# EasyEDA Pro project 不晦启明_srm A.eprj, board PCB1
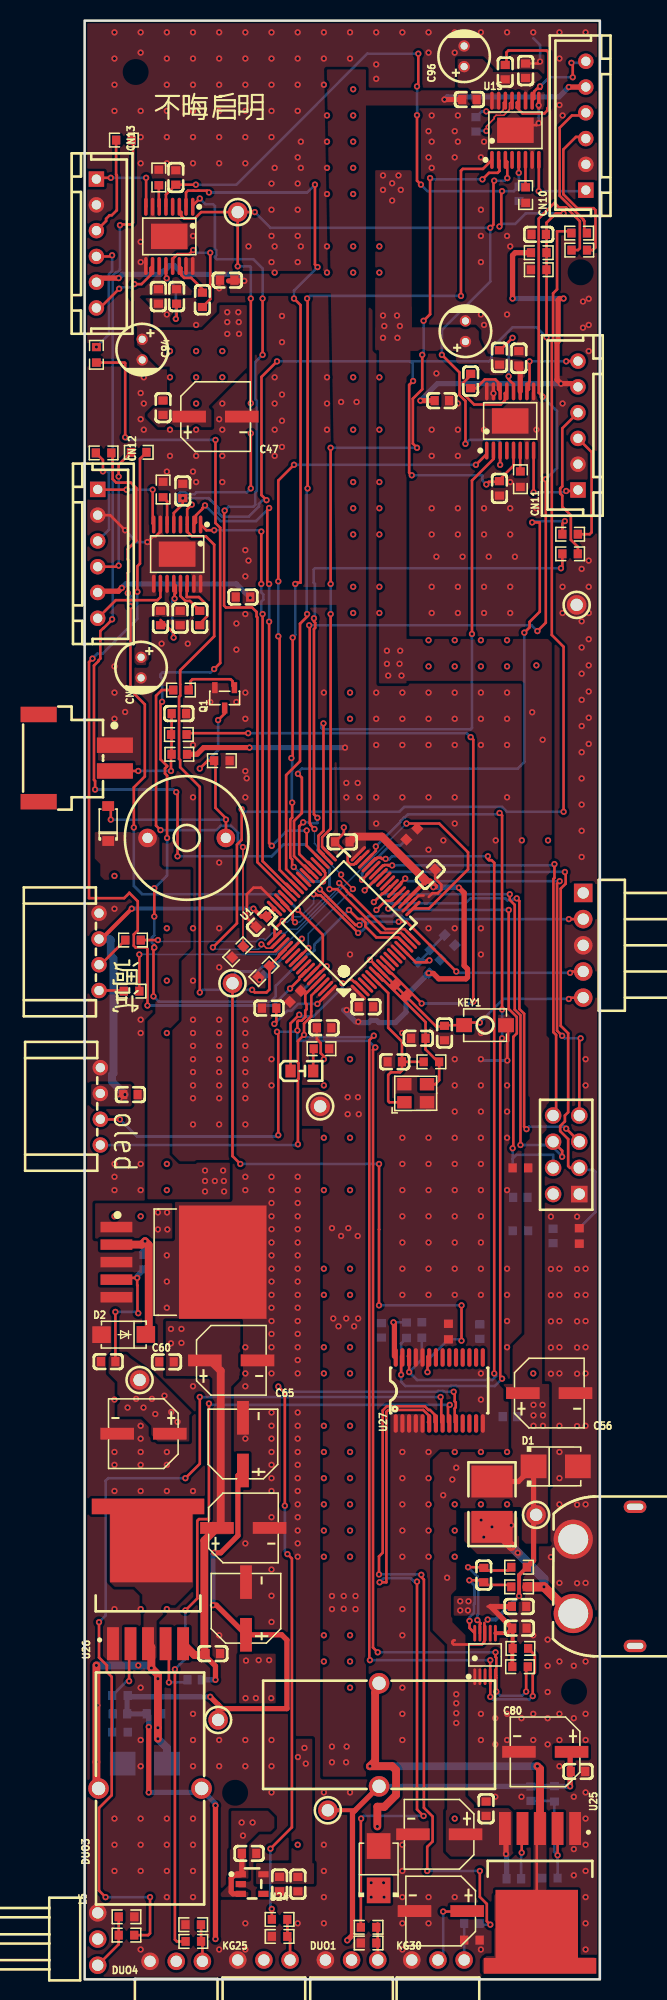
[diagram p13: board, top side]
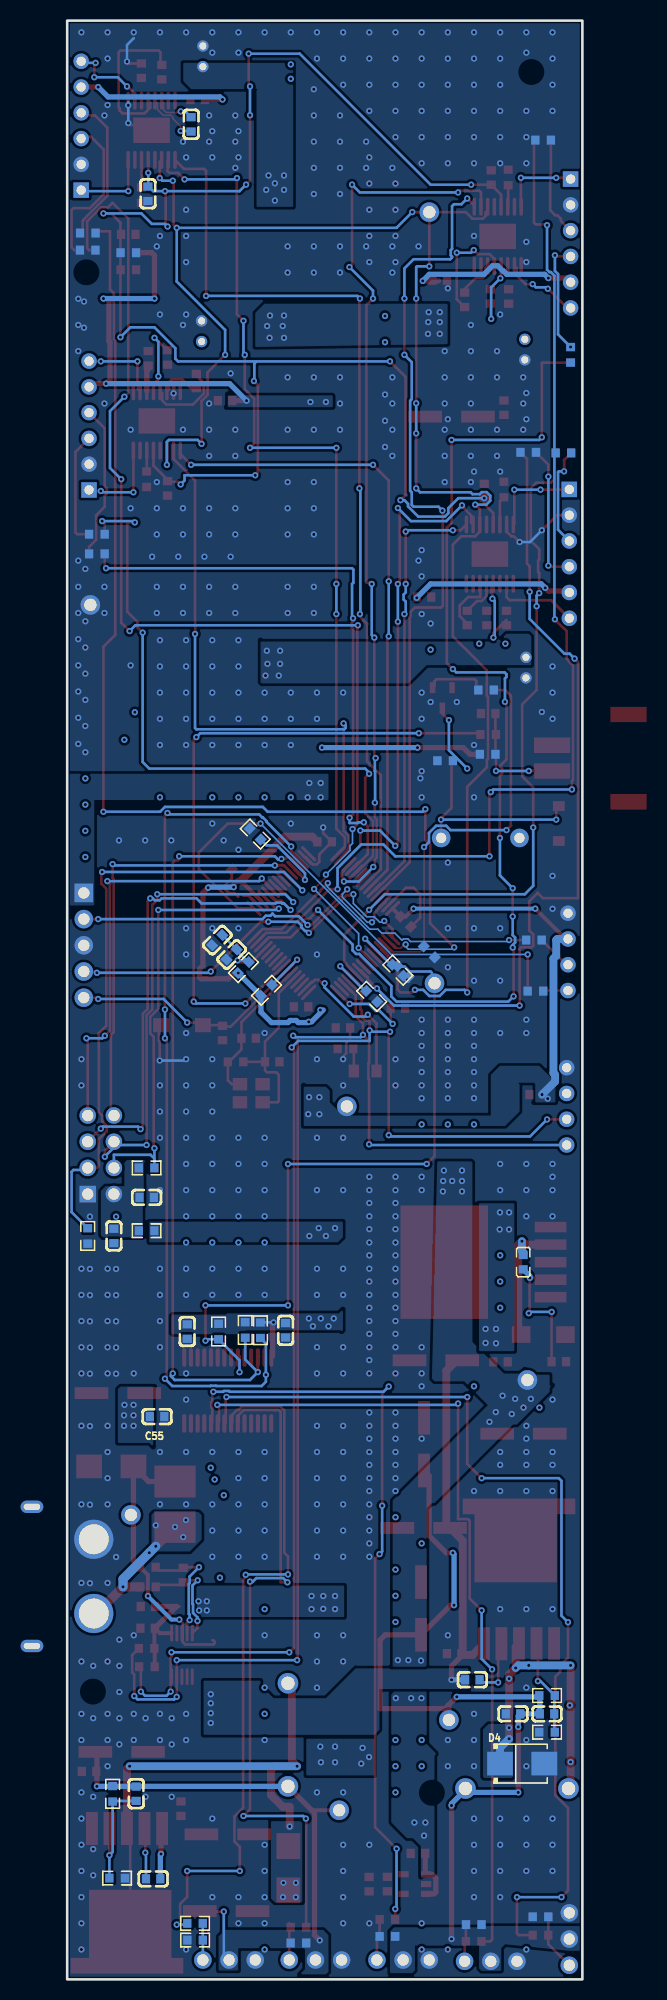
[diagram p14: board, bottom side, seen from below]

Outline 50 x 190 mm; copper layers: Top Layer, Bottom Layer. Coordinates in mm from the lower left corner of the outline.
Outline path: rectangle 50,0 0,190
Stack: Top Layer 0.035mm / Dielectric1 1.51mm FR4 er 4.5 / Bottom Layer 0.035mm

## Design rules (mm)
template: 自定义配置
spacing copperThickness1oz (default): track to track 0.102, other pairs 0.152 to 0.3
spacing copperThickness2oz: track to track 0.203, other pairs 0.152 to 0.3
track width copperThickness1oz (default): min 0.127, default 0.254, max 2.54
track width copperThickness2oz: min 0.203, default 0.254, max 2.54
differential pair differentialPair (default): width min 0.127, default 0.254, max 2.54; gap min 0.152, default 0.152
via viaSize (default): diameter min 0.5, default 0.61, max 10; hole min 0.3, default 0.305, max 6.3

## Placement (name value [footprint] x y rotation side)
BUZZER1  2.4kHz  [BUZ-TH_BD12.0-P7.60-D0.6-FD]  9.91 110.72 0 top
C10  15pF  [C0603]  32.39 91.29 0 top
C14  100nF  [C0603]  23.24 92.3 0 top
C15  100nF  [C0603]  33.53 107.16 225 top
C16  100nF  [C0603]  25.01 110.34 0 top
C17  100nF  [C0603]  17.14 102.59 45 top
C18  100nF  [C0603]  17.91 94.21 0 top
C24  15pF  [C0603]  30.1 89 0 top
C25  22nF  [C0603]  37.97 179.93 270 bottom
C26  100nF  [C0603]  40.82 185 270 top
C27  100nF  [C0603]  42.8 185.14 270 top
C28  100nF  [C0603]  42.16 173.2 90 bottom
C30  22nF  [C0603]  37.46 155.04 90 top
C31  100nF  [C0603]  40.26 157.33 270 top
C32  100nF  [C0603]  42.14 157.24 270 top
C33  100nF  [C0603]  40.26 144.63 90 top
C35  22nF  [C0603]  11.18 132.06 90 top
C36  100nF  [C0603]  7.37 132.06 90 top
C37  100nF  [C0603]  9.27 132.06 90 top
C38  100nF  [C0603]  9.52 144.37 270 top
C40  22nF  [C0603]  11.43 162.92 270 top
C41  100nF  [C0603]  8.93 163.24 90 top
C42  100nF  [C0603]  7.16 163.24 90 top
C43  100nF  [C0603]  8.85 174.78 270 top
C45  100nF  [C0603]  44.07 169.27 0 top
C46  1uF  [C0603]  7.61 152.46 270 top
C47  1000uF  [CAP-SMD_BD6.3-L6.6-W6.6-RD]  12.7 151.59 180 top
C48  100nF  [C0603]  37.34 182.35 0 top
C49  100nF  [C0603]  34.67 153.14 0 top
C50  100nF  [C0603]  15.37 134.09 180 top
C51  100nF  [C0603]  13.84 164.82 180 top
C52  100nF  [C0603]  38.73 39.22 270 top
C53  100nF  [C0603]  42.19 34.07 180 top
C54  1uF  [C0603]  42.16 36.17 180 top
C55  1uF  [C0603]  41.27 54.59 0 bottom
C56  1000uF  [CAP-SMD_BD6.3-L6.6-W6.6-RD]  45.08 56.87 180 top
C57  100nF  [C0603]  2.29 59.92 180 top
C60  100nF  [C0603]  7.95 59.9 0 top
C61  1uF  [C0603]  15.96 12.22 180 top
C62  1uF  [C0603]  20.7 9.24 90 top
C63  10uF  [C0603]  18.92 9.25 90 top
C64  330uF  [CAP-SMD_BD6.3-L6.6-W6.6-RD]  5.71 52.93 0 top
C65  220uF  [CAP-SMD_BD6.3-L6.6-W6.6-RD]  14.22 60.05 180 top
C66  1uF  [C0603]  38.96 16.55 90 top
C67  220uF  [CAP-SMD_BD6.3-L6.6-W6.6-RD]  34.42 14.07 0 top
C68  1uF  [C0603]  41.66 9.75 180 bottom
C69  1uF  [C0603]  47.88 20.17 0 top
C70  330uF  [CAP-SMD_BD6.3-L6.6-W6.6-RD]  34.57 6.63 0 top
C72  33nF  [C0603]  43.31 18.01 90 bottom
C73  1uF  [C0603]  12.45 31.6 0 top
C74  220uF  [CAP-SMD_BD6.3-L6.6-W6.6-RD]  15.4 43.79 180 top
C75  1uF  [C0603]  10.68 29.06 0 bottom
C76  1uF  [C0603]  6.73 25.76 0 bottom
C77  330uF  [CAP-SMD_BD6.3-L6.6-W6.6-RD]  15.66 35.98 270 top
C79  33nF  [C0603]  3.43 25.76 0 bottom
C80  2200uF  [CAP-SMD_BD6.3-L6.6-W6.6-RD]  44.7 22.07 0 top
C81  3300uF  [CAP-SMD_BD6.3-L6.6-W6.6-RD]  15.37 51.92 270 top
C82  1uF  [C0603]  38.35 62.84 270 bottom
C83  100nF  [C0603]  28.8 62.96 270 bottom
C84  100nF  [C0603]  35.43 100.81 315 bottom
C85  1uF  [C0603]  34.04 99.42 315 bottom
C86  4.7uF  [C0603]  27.3 94.34 180 top
C87  10uF  [C0603]  45.47 72.11 90 bottom
C88  100nF  [C0603]  42.28 75.85 0 bottom
C89  100nF  [C0603]  4.44 85.83 0 top
C90  100nF  [C0603]  9.14 122.78 0 top
C92  100uF  [CAP-TH_BD5.0-P2.00-D0.5-FD]  36.96 159.87 90 top
C94  100uF  [CAP-TH_BD5.0-P2.00-D0.5-FD]  5.59 158.09 270 top
C95  100uF  [CAP-TH_BD5.0-P2.00-D0.5-FD]  5.48 127.25 270 top
C96  100uF  [CAP-TH_BD5.0-P2.00-D0.5-FD]  36.83 186.54 90 top
C97  100nF  [C0603]  34.92 91.8 270 top
CN5  XT60PW-M  [CONN-TH_XT60PW-M]  50.42 39.09 180 top
CN6  HX-XH2.54-4PWZ-B  [CONN-TH_HX-XH2.54-4PWZ-B]  1.52 84.68 270 top
CN7  ZX-XH2.54-2PWT  [CONN-SMD_2P-P2.54_MEGASTAR_ZX-XH2.54-2PWT]  -0.76 118.47 270 top
CN9  HX-XH2.54-4PWZ-B  [CONN-TH_HX-XH2.54-4PWZ-B]  1.4 99.67 270 top
CN10  LAIL-PHC2.54-6P-01-XH-L  [CONN-TH_AXH-6A-11]  48.64 179.81 90 top
CN11  LAIL-PHC2.54-6P-01-XH-L  [CONN-TH_AXH-6A-11]  47.88 150.72 90 top
CN12  LAIL-PHC2.54-6P-01-XH-L  [CONN-TH_AXH-6A-11]  1.27 138.28 270 top
CN13  LAIL-PHC2.54-6P-01-XH-L  [CONN-TH_AXH-6A-11]  1.14 168.38 270 top
D1  SMBJ18A  [SMB_L4.3-W3.6-LS5.3-RD]  45.72 49.76 0 top
D2  SS54  [SMA_L4.3-W2.6-LS5.0-FD]  3.79 62.55 0 top
D3  SK1045B  [SMB_L4.3-W3.6-LS5.3-RD]  28.53 10.78 90 top
D4  SK1045B  [SMB_L4.3-W3.6-LS5.3-RD]  5.84 20.93 180 bottom
D10  1N4148W-E3-08  [SOD-123_L2.8-W1.8-LS3.7-RD]  2.29 112.12 90 top
DUO1  HX PZ2.54-1x3P WZ  [HDR-TH_3P-P2.54-H-M-W10.4-N]  25.91 1.88 0 top
DUO3  HX PZ2.54-1x3P WZ  [HDR-TH_3P-P2.54-H-M-W10.4-N]  1.27 3.91 270 top
DUO4  HX PZ2.54-1x3P WZ  [HDR-TH_3P-P2.54-H-M-W10.4-N]  8.89 1.75 0 top
H17  HX PZ2.54-1x5P WZ  [HDR-TH_5P-P2.54-H-M-W10.0-N]  48.39 100.31 270 top
H19  DS1023-2*4SF11  [HDR-TH_8P-P2.54-V-F-R2-C4-S2.54]  46.74 79.98 90 top
KEY1  轻触开关3x4x2  [SW-SMD_L4.0-W2.9-LS5.0]  38.86 92.56 0 top
KG25  HX PZ2.54-1x3P WZ  [HDR-TH_3P-P2.54-H-M-W10.4-N]  17.4 1.88 0 top
KG30  HX PZ2.54-1x3P WZ  [HDR-TH_3P-P2.54-H-M-W10.4-N]  34.29 1.88 0 top
L1  33uH  [L0603]  5.74 69.57 270 bottom
L4  47uH  [IND-TH_L22.5-W10.5-P10.00-D1.0]  28.58 23.72 0 top
L5  47uH  [IND-TH_L22.5-W10.5-P10.00-D1.0]  6.35 18.52 90 top
LED1  -  [LED0805-RD_RED]  21.08 88.11 0 top
Q1  S8050  [SOT-23-3_L2.9-W1.3-P1.90-LS2.3-BR]  13.59 124.31 90 top
R13  1M  [R0603#2]  33.65 89 180 top
R14  10kΩ  [R0603]  30.66 95.94 315 bottom
R18  2K  [R0603#2]  22.99 90.27 0 top
R27  10kΩ  [R0603]  44.07 167.49 180 top
R28  30K  [R0603#2]  44.07 165.84 180 top
R29  2.2K  [R0603#2]  42.8 173.08 90 top
R31  2.2K  [R0603#2]  42.29 145.52 90 top
R33  2.2K  [R0603#2]  7.62 144.52 270 top
R35  2.2K  [R0603#2]  7.2 174.78 270 top
R37  10kΩ  [R0603]  17.4 97.77 225 top
R39  1K  [R0603]  48.01 167.74 0 top
R40  1K  [R0603]  47.99 169.39 0 top
R41  1K  [R0603]  47.12 140.18 0 top
R42  1K  [R0603]  47.12 138.28 0 top
R43  1K  [R0603]  1.84 148.07 180 top
R44  1K  [R0603]  5.25 148.13 180 top
R45  1K  [R0603]  3.81 178.41 180 top
R46  1K  [R0603]  1.14 157.58 90 top
R47  10  [R0603#2]  42.16 38.08 0 top
R48  10  [R0603#2]  42.16 39.98 0 top
R49  4.7K  [R0603#2]  42.29 32.11 180 top
R50  4.7K  [R0603#2]  42.26 30.33 0 top
R52  12.4K  [R0603#2]  45.58 18 270 bottom
R53  3.3k  [R0603#2]  45.15 9.82 180 bottom
R54  12.4K  [R0603#2]  3.43 27.53 180 bottom
R55  3.3k  [R0603#2]  3.43 23.98 0 bottom
R56  330  [R0603#2]  27.56 5.06 0 top
R57  10kΩ  [R0603]  27.56 3.53 180 top
R58  330  [R0603#2]  37.59 5.44 180 bottom
R59  10kΩ  [R0603]  37.59 3.81 0 bottom
R60  330  [R0603#2]  4.06 4.29 180 top
R61  10kΩ  [R0603]  4.06 6.07 0 top
R64  330  [R0603#2]  10.55 3.68 0 top
R65  10kΩ  [R0603]  10.54 5.31 180 top
R66  330  [R0603#2]  18.92 5.82 0 top
R67  10kΩ  [R0603]  18.92 4.17 180 top
R68  4.7k  [R0603#2]  31.24 62.97 90 bottom
R69  4.7k  [R0603#2]  32.72 62.99 270 bottom
R70  10kΩ  [R0603]  35.31 62.84 90 bottom
R71  10kΩ  [R0603]  20.45 95.35 45 bottom
R72  10kΩ  [R0603]  31.75 111.1 45 bottom
R74  10  [R0603#2]  32.89 98.15 135 bottom
R75  0  [R0603#2]  42.29 72.62 0 bottom
R76  10kΩ  [R0603]  48.01 72.11 270 bottom
R77  10kΩ  [R0603]  42.29 78.72 0 bottom
R78  10kΩ  [R0603]  14.86 99.67 45 top
R79  10kΩ  [R0603]  9.19 118.83 180 top
R80  1k  [R0603#2]  9.14 120.75 180 top
R81  10kΩ  [R0603]  13.32 118.21 0 top
R83  1K  [R0603]  4.7 100.81 180 top
R84  1K  [R0603]  4.55 95.86 180 top
R85  1K  [R0603]  9.35 125.07 180 top
R86  10K  [R0603#2]  17.91 97.89 225 bottom
R87  2mΩ  [RES-SMD_L6.4-W3.2_SD2512]  39.53 46.09 270 top
U1  -  [LQFP-64_L10.0-W10.0-P0.50-LS12.0-BL]  25.15 102.46 45 top
U15  DRV8874PWPR  [HTSSOP-16_L5.0-W4.4-P0.65-LS6.4-BL-EP]  41.81 179.36 0 top
U19  DRV8874PWPR  [HTSSOP-16_L5.0-W4.4-P0.65-LS6.4-BL-EP]  41.3 151.17 0 top
U20  DRV8874PWPR  [HTSSOP-16_L5.0-W4.4-P0.65-LS6.4-BL-EP]  8.98 138.25 180 top
U21  DRV8874PWPR  [HTSSOP-16_L5.0-W4.4-P0.65-LS6.4-BL-EP]  8.22 169.07 180 top
U22  INA226AIDGSR  [MSOP-10_L3.0-W3.0-P0.50-LS5.0-BL]  38.86 31.47 0 top
U23  LM2596S-5.0(UMW)  [TO-263-5_L10.2-W8.9-P1.70-BR]  8.25 69.57 180 top
U24  AP2112K-3.3TRG1  [SOT-23-5_L2.9-W1.6-P0.95-LS2.8-BR]  16.26 9.25 180 top
U25  XL4015E1  [TO-263-5_L10.2-W8.9-P1.70-TL]  44.2 9.63 270 top
U26  XL4015E1  [TO-263-5_L10.2-W8.9-P1.70-TL]  6.15 37.57 90 top
U27  PCA9685PW,118  [TSSOP-28_L9.7-W4.4-P0.65-LS6.4-TL]  34.42 57.12 90 top
U28  RH-5000  [TEST-TH_BD2.54-P1.4_RED]  14.86 171.43 0 top
U29  RH-5000  [TEST-TH_BD2.54-P1.4_RED]  12.95 25.17 0 top
U30  RH-5000  [TEST-TH_BD2.54-P1.4_RED]  47.75 133.32 0 top
U31  RH-5000  [TEST-TH_BD2.54-P1.4_RED]  23.61 16.41 0 top
U32  RH-5000  [TEST-TH_BD2.54-P1.4_RED]  14.35 96.62 0 top
U33  RH-5000  [TEST-TH_BD2.54-P1.4_RED]  22.86 84.68 0 top
U34  RH-5000  [TEST-TH_BD2.54-P1.4_RED]  43.81 45.06 0 top
U35  RH-5000  [TEST-TH_BD2.54-P1.4_RED]  5.33 58.14 0 top
X5  8MHz  [OSC-SMD_4P-L3.2-W2.5-BL]  32.13 85.95 0 top

## Footprints (pads in the part's own frame, mm; a bottom-side part is the same pattern mirrored in y, then rotated)
BUZ-TH_BD12.0-P7.60-D0.6-FD
  round 1.8 hole 1: 1(-3.8,0) 2(3.8,0)
C0603
  rect 0.8x0.9 smd: 1(-0.7,0) 2(0.7,0)
CAP-SMD_BD6.3-L6.6-W6.6-RD
  rect 3.26x1.15 smd: 1(2.555,0) 2(-2.555,0)
CAP-TH_BD5.0-P2.00-D0.5-FD
  round 1.1 hole 0.7: 1(-1,0) 2(1,0)
CONN-SMD_2P-P2.54_MEGASTAR_ZX-XH2.54-2PWT
  rect 1.5x3.5 smd: 1(-1.25,3.7) 2(1.25,3.7) 3(-4.23,-3.7) 4(4.23,-3.7)
CONN-TH_AXH-6A-11
  rect 1.5x1.5 hole 0.9: 1(-6.25,0)
  round 1.5 hole 0.9: 2(-3.75,0) 3(-1.25,0) 4(1.25,0) 5(3.75,0) 6(6.25,0)
CONN-TH_HX-XH2.54-4PWZ-B
  round 1.5 hole 0.9: 1(-3.75,0) 2(-1.25,0) 3(1.25,0) 4(3.75,0)
CONN-TH_XT60PW-M
  round 3.8 hole 2.9: 1(3,-3.6) 2(3,3.6)
  oval 2.2x1.2 hole 1.6x0.6: 3(-3,6.75) 4(-3,-6.75)
HDR-TH_3P-P2.54-H-M-W10.4-N
  round 1.7 hole 1.1: 1(-2.54,0) 2(0,0) 3(2.54,0)
HDR-TH_5P-P2.54-H-M-W10.0-N
  rect 1.8x1.8 hole 1.1: 1(-5.08,0)
  round 1.8 hole 1.1: 2(-2.54,0) 3(0,0) 4(2.54,0) 5(5.08,0)
HDR-TH_8P-P2.54-V-F-R2-C4-S2.54
  rect 1.6x1.6 hole 1.1: 1(-3.81,-1.27)
  round 1.6 hole 1.1: 2(-3.81,1.27) 3(-1.27,-1.27) 4(-1.27,1.27) 5(1.27,-1.27) 6(1.27,1.27) 7(3.81,-1.27) 8(3.81,1.27)
HTSSOP-16_L5.0-W4.4-P0.65-LS6.4-BL-EP
  oval 0.343x1.746 smd: 1(-2.275,-2.873) 2(-1.625,-2.873) 3(-0.975,-2.873) 4(-0.325,-2.873) 5(0.325,-2.873) 6(0.975,-2.873) 7(1.625,-2.873) 8(2.275,-2.873) 9(2.275,2.873) 10(1.625,2.873) 11(0.975,2.873) 12(0.325,2.873) 13(-0.325,2.873) 14(-0.975,2.873) 15(-1.625,2.873) 16(-2.275,2.873)
  rect 3.55x2.46 smd: 17(0,0)
IND-TH_L22.5-W10.5-P10.00-D1.0
  round 2 hole 1.3: 1(0,-5) 2(0,5)
L0603
  rect 0.8x0.864 smd: 1(-0.7,0) 2(0.7,0)
LED0805-RD_RED
  rect 1x1.25 smd: 1(-1.1,0) 2(1.1,0)
LQFP-64_L10.0-W10.0-P0.50-LS12.0-BL
  oval 0.3x2 smd: 1(-3.75,-5.75) 2(-3.25,-5.75) 3(-2.75,-5.75) 4(-2.25,-5.75) 5(-1.75,-5.75) 6(-1.25,-5.75) 7(-0.75,-5.75) 8(-0.25,-5.75) 9(0.25,-5.75) 10(0.75,-5.75) 11(1.25,-5.75) 12(1.75,-5.75) 13(2.25,-5.75) 14(2.75,-5.75) 15(3.25,-5.75) 16(3.75,-5.75) 33(3.75,5.75) 34(3.25,5.75) 35(2.75,5.75) 36(2.25,5.75) 37(1.75,5.75) 38(1.25,5.75) 39(0.75,5.75) 40(0.25,5.75) 41(-0.25,5.75) 42(-0.75,5.75) 43(-1.25,5.75) 44(-1.75,5.75) 45(-2.25,5.75) 46(-2.75,5.75) 47(-3.25,5.75) 48(-3.75,5.75)
  oval 2x0.3 smd: 17(5.75,-3.75) 18(5.75,-3.25) 19(5.75,-2.75) 20(5.75,-2.25) 21(5.75,-1.75) 22(5.75,-1.25) 23(5.75,-0.75) 24(5.75,-0.25) 25(5.75,0.25) 26(5.75,0.75) 27(5.75,1.25) 28(5.75,1.75) 29(5.75,2.25) 30(5.75,2.75) 31(5.75,3.25) 32(5.75,3.75) 49(-5.75,3.75) 50(-5.75,3.25) 51(-5.75,2.75) 52(-5.75,2.25) 53(-5.75,1.75) 54(-5.75,1.25) 55(-5.75,0.75) 56(-5.75,0.25) 57(-5.75,-0.25) 58(-5.75,-0.75) 59(-5.75,-1.25) 60(-5.75,-1.75) 61(-5.75,-2.25) 62(-5.75,-2.75) 63(-5.75,-3.25) 64(-5.75,-3.75)
MSOP-10_L3.0-W3.0-P0.50-LS5.0-BL
  oval 0.28x1.62 smd: 1(-1,-2.11) 2(-0.5,-2.11) 3(0,-2.11) 4(0.5,-2.11) 5(1,-2.11) 6(1,2.11) 7(0.5,2.11) 8(0,2.11) 9(-0.5,2.11) 10(-1,2.11)
OSC-SMD_4P-L3.2-W2.5-BL
  rect 1.4x1.2 smd: 1(-1.1,-0.875) 2(1.1,-0.875) 3(1.1,0.875) 4(-1.1,0.875)
R0603
  rect 0.806x0.864 hole 0.001: 1(-0.753,0) 2(0.753,0)
R0603#2
  rect 0.806x0.864 smd: 1(-0.753,0) 2(0.753,0)
RES-SMD_L6.4-W3.2_SD2512
  rect 3.1x4 smd: 1(-2.2,0) 2(2.2,0)
SMA_L4.3-W2.6-LS5.0-FD
  rect 1.8x1.62 smd: 1(-2.15,-0.009) 2(2.15,0.009)
SMB_L4.3-W3.6-LS5.3-RD
  rect 2.5x2.3 smd: 1(-2.15,0) 2(2.15,0)
SOD-123_L2.8-W1.8-LS3.7-RD
  rect 0.95x1.15 smd: 1(-1.692,0) 2(1.692,0)
SOT-23-3_L2.9-W1.3-P1.90-LS2.3-BR
  rect 1.07x0.532 smd: 1(0.99,-0.95) 2(0.99,0.95) 3(-0.99,0)
SOT-23-5_L2.9-W1.6-P0.95-LS2.8-BR
  rect 1x0.6 smd: 1(1.1,-0.95) 2(1.1,0) 3(1.1,0.95) 4(-1.1,0.95) 5(-1.1,-0.95)
SW-SMD_L4.0-W2.9-LS5.0
  rect 1.53x1.36 smd: 1(-2.035,0) 2(2.035,0)
TEST-TH_BD2.54-P1.4_RED
  round 1.9 hole 1.2: 1(0,0)
TO-263-5_L10.2-W8.9-P1.70-BR
  rect 3.083x1.02 smd: 1(5.16,-3.4) 2(5.16,-1.7) 3(5.16,0) 4(5.16,1.7) 5(5.16,3.4)
  rect 8.5x11 smd: 6(-5.16,0)
TO-263-5_L10.2-W8.9-P1.70-TL
  rect 3.2x1.15 smd: 1(-5.008,3.404) 2(-5.008,1.702) 3(-5.008,0) 4(-5.008,-1.702) 5(-5.008,-3.404)
  custom 8.128x10.922 smd: 6(5.008,-0.318)
TSSOP-28_L9.7-W4.4-P0.65-LS6.4-TL
  oval 1.804x0.406 smd: 1(-3.2,4.225) 2(-3.2,3.575) 3(-3.2,2.925) 4(-3.2,2.275) 5(-3.2,1.625) 6(-3.2,0.975) 7(-3.2,0.325) 8(-3.2,-0.325) 9(-3.2,-0.975) 10(-3.2,-1.625) 11(-3.2,-2.275) 12(-3.2,-2.925) 13(-3.2,-3.575) 14(-3.2,-4.225) 15(3.2,-4.225) 16(3.2,-3.575) 17(3.2,-2.925) 18(3.2,-2.275) 19(3.2,-1.625) 20(3.2,-0.975) 21(3.2,-0.325) 22(3.2,0.325) 23(3.2,0.975) 24(3.2,1.625) 25(3.2,2.275) 26(3.2,2.925) 27(3.2,3.575) 28(3.2,4.225)

## Nets
As in the schematic.

Pads without a net: CN5 3 4; CN7 3 4; U1 3 4 9 10 11 24 25 39 40 45 54 56 57; U15 4; U19 4; U20 4; U21 4; U22 3; U24 4; U27 11 12 13 15 16 17 18 19 20 21 22

## Via types
v1: diameter 0.61, hole 0.305, Top Layer to Bottom Layer, 1092 vias

## Routing (per net, layer and track width the routed paths; a pad name or vN(x,y) marks a point on that pad's centre or on a via; arc(x,y) is an arc through that point)
3V3: length 202.3
  Top Layer w0.254: C18.2 18.61,92.88 v1(18.42,92.69) ; v1(22.59,94.62) 23.72,95.75 U1.64 ; 39.39,36.17 39.12,36.17
  Top Layer w0.381: U1.48 17.64,103.09 17.64,103.09 17.16,103.09 v1(16.38,103.86) ; 41.54,34.02 R49.2 41.5,32.07 R50.1 ; CN9.2 1.63,100.92 v1(4.57,103.86) ; U1.19 33.02,106.45 33.02,106.66 33.03,106.67 ; C53.2 41.01,33.58 U22.6
  Top Layer w0.508: v1(33.85,105.94) 33.92,106.02 34.04,106.02 33.53,106.53 33.17,106.53 33.03,106.67 ; v1(32.59,153.14) 33.84,153.14 33.97,153.26 ; v1(34.92,182.35) C48.1 ; 33.34,97.57 33.85,97.57 34.37,97.05 37.01,97.05 37.16,97.21 37.16,98.01 36.83,98.34 36.83,105.39 v1(36.32,105.89) ; v1(16,119.48) 11.56,119.48 10.91,118.83 R79.1 ; v1(3.61,134.98) 3.29,134.66 1.4,134.66 ; 30.06,60.45 30.06,63.64 v1(29.97,63.73) ; C53.2 39.39,36.17 41.46,36.17 ; CN10.5 v1(46.99,183.56) ; v1(41.53,163.04) 41.53,167.23 41.78,167.49 R27.2 ; v1(15.49,164.75) 13.97,164.75 ; CN11.5 47.56,154.79 v1(46.23,154.79) 45.85,155.17 45.85,158.79 45.95,158.89 45.95,162.89 46.1,163.04 v1(46.48,163.04) ; 1.27,164.75 1.54,165.02 v1(3.3,165.02)
  Top Layer w0.762: C16.2 26.22,110.85 28.85,110.85 33.03,106.67
  Bottom Layer w0.254: v1(18.42,92.69) 19.68,93.95 20.05,93.95 20.72,94.62 v1(22.59,94.62) ; v1(29.97,63.73) 31.43,63.73 31.5,63.79
  Bottom Layer w0.381: v1(4.57,103.86) v1(16.38,103.86)
  Bottom Layer w0.508: v1(46.23,154.79) 34.24,154.79 v1(32.59,153.14) ; v1(34.92,182.35) 35.18,182.6 46.03,182.6 v1(46.99,183.56) ; R74.1 v1(33.4,97.61) R14.2 31.19,93.83 30.17,92.81 28.56,92.81 28.36,93.02 27.77,93.02 27.57,92.81 26.63,92.81 v1(26.55,92.89) 26.29,92.89 25.15,94.03 ; v1(16,119.48) v1(25.27,119.48) ; v1(46.48,163.04) v1(41.53,163.04) ; v1(16.08,134.01) 14.73,135.36 3.99,135.36 v1(3.61,134.98) ; v1(36.32,105.89) 36.27,105.94 v1(33.85,105.94) ; v1(15.49,164.75) 14.86,165.39 9.55,165.39 8.71,166.22 8.23,166.22 7.72,165.72 7.67,165.72 7.34,165.39 3.67,165.39 v1(3.3,165.02)
  Bottom Layer w0.762: CN9.2 2.43,100.92 2.54,100.81 2.54,99.29 2.81,99.02 2.81,87.9 2.68,87.78 2.68,87.75 2.64,87.71 2.64,87.1 v1(3.91,85.83)
  vias: v1(3.36,85.43) v1(20.7,21.56) v1(21.34,22.45) v1(21.46,20.93) v1(24,72.87) v1(24,37.19) v1(24,35.92) v1(24,22.58) v1(24,21.06) v1(24.13,64.11) v1(24.64,63.35) v1(24.89,153.01) v1(24.89,72.11) v1(25.15,37.19) v1(25.15,35.95) v1(25.37,21.06) v1(25.4,116.05) v1(25.4,114.66) v1(25.43,94.03) v1(25.39,64.11) v1(25.43,22.58) v1(25.53,85.57) v1(25.53,83.92) v1(25.59,72.87) v1(26.15,63.35) v1(26.29,37.19) v1(26.29,35.92) v1(26.39,153.01) v1(26.5,116.05) v1(26.52,85.57) v1(26.5,72.11) v1(26.55,64.11) v1(26.66,114.66) v1(26.61,83.92) v1(36.45,36.68) v1(36.45,35.79) v1(37.26,36.68) v1(37.2,35.79)
5V_LOGIC: length 19.2
  Top Layer w0.254: U23.4 3.26,68.05 v1(5.1,68.05) 5.1,67.33 5.13,67.31 5.13,64.7 v1(5.21,64.62) ; v1(2.99,64.75) C57.1
  Top Layer w0.508: 15.09,10.13 14.53,10.13 14.22,9.83 14.22,8.48 14.4,8.3 15.16,8.3 ; U24.1 15.26,10.3 C61.2
  Bottom Layer w0.254: v1(5.21,64.62) 5.08,64.75 v1(2.99,64.75)
  Bottom Layer w0.508: L1.2 5.1,68.24 v1(5.1,68.05)
  vias: v1(4.17,55.46) v1(5,56.31) v1(5.71,55.46) v1(6.52,56.31) v1(6.86,54.84) v1(7.75,56.62) v1(8.41,55.03) v1(9.02,54.08) v1(11.68,78.46) v1(11.68,77.45) v1(11.68,76.43) v1(12.64,77.45) v1(13.44,78.46) v1(13.51,77.45) v1(13.54,76.43) v1(15.24,15.22) v1(15.37,13.94) v1(15.66,30.92) v1(15.62,27.28) v1(16.31,15.22) v1(16.62,27.28) v1(16.89,30.96) v1(17.91,30.96) v1(18.11,27.28)
GND: length 44.8
  Top Layer w0.254: 32.89,105.13 32.41,105.13 31.51,104.23 ; 42.31,179.86 43.87,179.86 v1(44.07,180.06) ; U1.47 17.12,105.89 16.38,105.89 15.75,105.26 15.75,102.97 16.62,102.1 16.65,102.1 ; CN12.2 2.47,142.03 v1(3.94,140.56) ; U1.31 26.81,108.83 26.14,108.15 25.78,108.15 25.53,108.4 25.53,109.13 C16.1 25.16,111.19 v1(25.16,111.73) ; 34.02,107.66 34.02,106.78 34.62,106.19 34.62,105.7 34.28,105.36 33.76,105.36 33.4,105 ; v1(6.1,139.42) 6.65,139.97 6.89,139.97 7.35,140.44 U20.7 ; v1(23.22,89.26) 23.22,89.53 22.92,89.84 22.92,90.82 22.54,91.19 C14.1 ; v1(44.2,186.03) 44.01,185.84 C27.1 ; v1(41.02,89.13) 41.02,90.97 41.1,91.05 41.1,92.36 KEY1.2
  Bottom Layer w0.254: v1(6.1,139.42) 5.08,139.42 v1(3.94,140.56) ; v1(41.02,89.13) 38.35,89.13 38.35,89.15 v1(38.46,89.26) ; 44.07,182.09 v1(44.07,181.78) v1(44.07,180.06) ; 43.54,188.29 44.2,187.64 v1(44.2,186.03)
  vias: v1(2.9,188.86) v1(2.9,186.32) v1(2.9,183.78) v1(2.9,181.24) v1(2.9,127.36) v1(2.9,124.82) v1(2.9,122.28) v1(2.9,107.04) v1(2.9,103.85) v1(2.9,79.1) v1(2.9,77.85) v1(2.9,76.56) v1(2.9,74.02) v1(2.9,56.24) v1(2.9,51.16) v1(2.9,49.91) v1(2.9,47.37) v1(2.9,35.92) v1(2.9,15.6) v1(2.9,13.06) v1(2.9,10.52) v1(3.93,122.94) v1(5.44,188.86) v1(5.44,186.9) v1(5.44,181.24) v1(5.44,178.7) v1(5.44,176.16) v1(5.44,168.54) v1(5.44,166.58) v1(5.44,153.88) v1(5.44,151.34) v1(5.44,93.09) v1(5.44,91.8) v1(5.44,79.1) v1(5.44,76.56) v1(5.44,74.02) v1(5.44,53.7) v1(5.44,52.45) v1(5.44,51.16) v1(5.44,49.91) v1(5.44,47.37) v1(5.44,35.92) v1(5.44,28.3) v1(5.44,23.22) v1(5.44,20.68) v1(5.44,15.6) v1(5.44,13.06) v1(5.44,10.52) v1(5.44,2.9) v1(5.74,155.4) v1(5.74,152.86) v1(5.74,150.32) v1(7.47,129.56) v1(7.98,188.86) v1(7.98,186.32) v1(7.98,183.78) v1(7.98,181.24) v1(7.98,178.7) v1(7.98,176.16) v1(7.98,161.5) v1(7.98,146.26) v1(7.98,101.96) v1(7.98,96.88) v1(7.98,91.8) v1(7.98,79.1) v1(7.98,76.56) v1(7.98,70.23) v1(7.98,67.69) v1(7.98,65.15) v1(7.98,51.16) v1(7.98,49.91) v1(7.98,47.37) v1(7.98,35.92) v1(7.98,15.6) v1(7.98,13.06) v1(7.98,10.52) v1(7.98,7.98) v1(8.28,157.94) v1(8.28,155.4) v1(8.28,150.32) v1(8.28,147.78) v1(10.01,129.56) v1(10.52,188.86) v1(10.52,186.32) v1(10.52,183.78) v1(10.52,181.24) v1(10.52,178.7) v1(10.52,176.16) v1(10.52,169.12) v1(10.52,146.26) v1(10.52,119.74) v1(10.52,114.66) v1(10.52,101.96) v1(10.52,96.88) v1(10.52,93.09) v1(10.52,91.8) v1(10.52,90.55) v1(10.52,89.26) v1(10.52,88.01) v1(10.52,86.72) v1(10.52,85.47) v1(10.52,82.93) v1(10.52,57.53) v1(10.52,47.37) v1(10.52,25.76) v1(10.52,23.22) v1(10.52,20.68) v1(10.52,15.6) v1(10.52,13.06) v1(10.52,10.52) v1(10.52,7.98) v1(10.82,160.48) v1(10.82,157.94) v1(10.82,155.4) v1(10.82,152.86) v1(10.82,150.32) v1(10.82,147.78) v1(10.82,145.24) v1(12.19,123.9) v1(13.06,188.86) v1(13.06,186.32) v1(13.06,183.78) v1(13.06,181.24) v1(13.06,178.7) v1(13.06,176.16) v1(13.06,164.04) v1(13.06,151.34) v1(13.06,108.33) v1(13.06,101.96) v1(13.06,98.17) v1(13.06,93.09) v1(13.06,91.8) v1(13.06,90.55) v1(13.06,89.26) v1(13.06,88.01) v1(13.06,86.72) v1(13.06,85.47) v1(13.06,82.93) v1(13.06,33.38) v1(13.06,23.22) v1(13.06,20.68) v1(13.06,2.9) v1(13.36,157.94) v1(13.36,155.4) v1(13.36,152.86) v1(13.36,150.32) v1(13.36,147.78) v1(13.36,145.24) v1(14.73,131.52) v1(14.73,128.98) v1(14.73,123.9) v1(15.6,188.86) v1(15.6,186.32) v1(15.6,183.78) v1(15.6,181.24) v1(15.6,178.7) v1(15.6,176.16) v1(15.6,138.64) v1(15.6,136.1) v1(15.6,132.44) v1(15.6,124.82) v1(15.6,122.28) v1(15.6,117.2) v1(15.6,114.66) v1(15.6,93.09) v1(15.6,91.8) v1(15.6,90.55) v1(15.6,89.26) v1(15.6,88.01) v1(15.6,86.72) v1(15.6,85.47) v1(15.6,82.93) v1(15.6,77.85) v1(15.6,76.56) v1(15.6,61.32) v1(15.6,58.78) v1(15.6,57.53) v1(15.6,52.45) v1(15.6,42.29) v1(15.6,23.22) v1(15.6,20.68) v1(15.6,5.44) v1(15.6,2.9) v1(15.73,116.5) v1(15.9,168.1) v1(15.9,137.62) v1(16.98,96.95) v1(18.14,188.86) v1(18.14,186.32) v1(18.14,183.78) v1(18.14,181.24) v1(18.14,178.7) v1(18.14,174.2) v1(18.14,171.66) v1(18.14,169.12) v1(18.14,166.58) v1(18.14,89.26) v1(18.14,86.72) v1(18.14,77.85) v1(18.14,76.56) v1(18.14,75.31) v1(18.14,74.02) v1(18.14,72.77) v1(18.14,71.48) v1(18.14,70.23) v1(18.14,68.94) v1(18.14,67.69) v1(18.14,66.4) v1(18.14,65.15) v1(18.14,63.86) v1(18.14,62.61) v1(18.14,61.32) v1(18.14,58.78) v1(18.14,54.99) v1(18.14,53.7) v1(18.14,52.45) v1(18.14,51.16) v1(18.14,49.91) v1(18.14,48.62) v1(18.14,47.37) v1(18.14,44.83) v1(18.14,39.75) v1(18.14,37.21) v1(18.14,34.67) v1(18.14,23.22) v1(18.14,20.68) v1(18.14,18.14) v1(18.44,175.72) v1(18.44,168.1) v1(18.44,165.56) v1(18.44,155.4) v1(18.44,152.86) v1(18.44,150.32) v1(18.44,147.78) v1(19.15,161.35) v1(19.15,158.81) v1(19.15,153.73) v1(19.15,151.19) v1(19.15,148.65) v1(20.68,188.86) v1(20.68,186.32) v1(20.68,183.78) v1(20.68,181.24) v1(20.68,176.74) v1(20.68,174.2) v1(20.68,171.66) v1(20.68,169.12) v1(20.68,166.58) v1(20.68,77.85) v1(20.68,76.56) v1(20.68,75.31) v1(20.68,74.02) v1(20.68,72.77) v1(20.68,71.48) v1(20.68,70.23) v1(20.68,68.94) v1(20.68,67.69) v1(20.68,66.4) v1(20.68,65.15) v1(20.68,63.86) v1(20.68,62.61) v1(20.68,61.32) v1(20.68,60.07) v1(20.68,58.78) v1(20.68,54.99) v1(20.68,53.7) v1(20.68,52.45) v1(20.68,51.16) v1(20.68,49.91) v1(20.68,48.62) v1(20.68,47.37) v1(20.68,46.08) v1(20.68,44.83) v1(20.68,43.54) v1(20.68,42.29) v1(20.68,41) v1(20.68,13.06) v1(20.68,5.44) v1(20.98,178.26) v1(20.98,175.72) v1(20.98,168.1) v1(23.22,188.86) v1(23.22,186.32) v1(23.22,183.78) v1(23.22,124.82) v1(23.22,86.72) v1(23.22,81.64) v1(23.22,76.56) v1(23.22,68.94) v1(23.22,66.4) v1(23.22,61.32) v1(23.22,58.78) v1(23.22,53.7) v1(23.22,51.16) v1(23.22,48.62) v1(23.22,46.08) v1(23.22,43.54) v1(23.22,41) v1(23.22,33.38) v1(23.22,30.84) v1(23.22,18.14) v1(23.22,13.06) v1(23.22,10.52) v1(23.22,7.98) v1(23.22,5.44) v1(23.52,180.8) v1(23.52,178.26) v1(23.52,175.72) v1(23.52,173.18) v1(23.52,168.1) v1(23.52,165.56) v1(23.52,155.4) v1(23.52,152.86) v1(23.52,150.32) v1(25.76,188.86) v1(25.76,186.32) v1(25.76,124.82) v1(25.76,122.28) v1(25.76,99.42) v1(25.76,89.26) v1(25.76,81.64) v1(25.76,76.56) v1(25.76,68.94) v1(25.76,66.4) v1(25.76,61.32) v1(25.76,58.78) v1(25.76,53.7) v1(25.76,51.16) v1(25.76,48.62) v1(25.76,46.08) v1(25.76,43.54) v1(25.76,41) v1(25.76,33.38) v1(25.76,30.84) v1(25.76,28.3) v1(25.76,18.14) v1(26.06,183.34) v1(26.06,180.8) v1(26.06,178.26) v1(26.06,175.72) v1(26.06,173.18) v1(26.06,168.1) v1(26.06,165.56) v1(26.06,155.4) v1(26.06,150.32) v1(26.06,145.24) v1(26.06,142.7) v1(26.06,140.16) v1(26.06,135.08) v1(26.06,132.54) v1(28.3,188.86) v1(28.3,185.75) v1(28.3,184.36) v1(28.3,124.82) v1(28.3,122.28) v1(28.3,119.74) v1(28.3,114.66) v1(28.3,112.12) v1(28.6,168.1) v1(28.6,165.56) v1(28.6,155.4) v1(28.6,150.32) v1(28.6,145.24) v1(28.6,142.7) v1(28.6,140.16) v1(28.6,135.08) v1(28.6,132.54) v1(30.84,188.86) v1(30.84,124.82) v1(30.84,122.28) v1(30.84,119.74) v1(30.84,114.66) v1(30.84,91.8) v1(30.84,81.64) v1(30.84,79.1) v1(30.84,76.56) v1(30.84,74.02) v1(30.84,71.48) v1(30.84,68.94) v1(30.84,66.4) v1(30.84,51.16) v1(30.84,48.62) v1(30.84,46.08) v1(30.84,43.54) v1(30.84,41) v1(30.84,35.92) v1(30.84,33.38) v1(30.84,28.3) v1(30.84,25.76) v1(30.84,23.22) v1(30.84,13.06) v1(30.84,10.52) v1(30.84,7.98) v1(30.84,5.44) v1(30.84,2.9) v1(33.38,188.86) v1(33.38,186.9) v1(33.38,179.28) v1(33.38,176.74) v1(33.38,129.9) v1(33.38,127.36) v1(33.38,124.82) v1(33.38,122.28) v1(33.38,119.74) v1(33.38,114.66) v1(33.38,109.58) v1(33.38,101.96) v1(33.38,81.64) v1(33.38,79.1) v1(33.38,76.56) v1(33.38,74.02) v1(33.38,71.48) v1(33.38,68.94) v1(33.38,66.4) v1(33.38,51.16) v1(33.38,48.62) v1(33.38,46.08) v1(33.38,43.54) v1(33.38,41) v1(33.38,7.98) v1(33.38,5.44) v1(33.68,180.8) v1(33.68,178.26) v1(33.68,175.72) v1(33.68,150.32) v1(33.68,147.78) v1(33.68,142.7) v1(33.68,140.16) v1(33.68,135.08) v1(33.68,132.54) v1(34.14,155.78) v1(34.14,138) v1(34.81,110.48) v1(35.92,188.86) v1(35.92,186.9) v1(35.92,179.28) v1(35.92,176.74) v1(35.92,129.9) v1(35.92,127.36) v1(35.92,124.82) v1(35.92,122.28) v1(35.92,119.74) v1(35.92,114.66) v1(35.92,112.12) v1(35.92,101.96) v1(35.92,89.26) v1(35.92,86.72) v1(35.92,84.18) v1(35.92,81.64) v1(35.92,79.1) v1(35.92,76.56) v1(35.92,74.02) v1(35.92,71.48) v1(35.92,68.94) v1(35.92,66.4) v1(35.92,51.16) v1(35.92,46.08) v1(35.92,43.54) v1(35.92,41) v1(35.92,15.6) v1(35.92,7.98) v1(36.22,180.8) v1(36.22,178.26) v1(36.22,152.86) v1(36.22,150.32) v1(36.22,147.78) v1(36.22,142.7) v1(36.22,140.16) v1(36.22,135.08) v1(36.22,132.54) v1(36.68,138) v1(38.46,188.86) v1(38.46,176.74) v1(38.46,171.66) v1(38.46,169.12) v1(38.46,166.58) v1(38.46,161.5) v1(38.46,129.9) v1(38.46,127.36) v1(38.46,124.82) v1(38.46,122.28) v1(38.46,119.74) v1(38.46,101.96) v1(38.46,99.42) v1(38.46,91.8) v1(38.46,86.72) v1(38.46,84.18) v1(38.46,81.64) v1(38.46,79.1) v1(38.46,76.56) v1(38.46,74.02) v1(38.46,71.48) v1(38.46,68.94) v1(38.46,66.4) v1(38.46,58.78) v1(38.46,56.24) v1(38.46,51.16) v1(38.46,46.08) v1(38.46,25.76) v1(38.46,23.22) v1(38.46,2.9) v1(38.76,178.26) v1(38.76,160.48) v1(38.76,150.32) v1(38.76,142.7) v1(38.76,140.16) v1(38.76,135.08) v1(38.76,132.54) v1(39.22,138) v1(39.67,153.85) v1(39.86,25.33) v1(39.86,22.79) v1(39.86,17.71) v1(39.89,110.48) v1(41,188.86) v1(41,169.12) v1(41,161.5) v1(41,129.9) v1(41,127.36) v1(41,124.82) v1(41,122.28) v1(41,119.74) v1(41,114.66) v1(41,86.72) v1(41,84.18) v1(41,81.64) v1(41,76.56) v1(41,68.94) v1(41,66.4) v1(41,63.86) v1(41,61.32) v1(41,51.16) v1(41,46.08) v1(41,25.76) v1(41,23.22) v1(41.3,168.1) v1(41.3,145.24) v1(41.3,142.7) v1(41.3,140.16) v1(41.3,135.08) v1(41.3,132.54) v1(41.76,138) v1(42.43,110.48) v1(42.39,25.33) v1(42.39,17.71) v1(43.54,188.86) v1(43.54,58.78) v1(43.54,33.38) v1(43.54,25.76) v1(43.54,23.22) v1(43.84,150.32) v1(43.84,142.7) v1(43.84,127.46) v1(44.97,110.48) v1(44.93,32.95) v1(44.93,30.41) v1(44.93,27.87) v1(44.93,25.33) v1(44.93,22.79) v1(45.25,73.99) v1(45.25,68.91) v1(45.25,66.37) v1(45.25,63.83) v1(45.25,61.29) v1(45.25,58.75) v1(45.25,40.97) v1(46.08,188.86) v1(46.08,186.32) v1(46.08,181.82) v1(46.08,68.94) v1(46.08,66.4) v1(46.08,63.86) v1(46.08,61.32) v1(46.08,58.78) v1(46.08,53.7) v1(46.08,51.16) v1(46.08,48.62) v1(46.08,46.08) v1(46.08,38.46) v1(46.08,30.84) v1(46.08,25.76) v1(46.08,23.22) v1(46.08,20.68) v1(46.38,180.8) v1(46.38,152.86) v1(46.38,135.08) v1(46.38,132.54) v1(47.48,30.41) v1(47.48,25.33) v1(47.48,17.71) v1(47.48,12.63) v1(47.48,10.09) v1(47.79,73.99) v1(47.79,68.91) v1(47.79,66.37) v1(47.79,63.83) v1(47.79,61.29) v1(47.79,58.75) v1(47.79,53.67) v1(47.79,46.05) v1(47.79,38.43) v1(48.24,136.81) v1(48.24,131.73) v1(48.24,129.19) v1(48.24,126.65) v1(48.24,124.11) v1(48.24,121.57) v1(48.24,119.03) v1(48.24,116.49) v1(48.24,113.95) v1(48.24,111.41) v1(48.24,108.87) v1(48.36,162.75) v1(48.36,160.21) v1(48.62,188.86) v1(48.62,89.26) v1(48.62,86.72) v1(48.62,68.94) v1(48.62,66.4) v1(48.62,63.86) v1(48.62,61.32) v1(48.62,58.78) v1(48.62,53.7) v1(48.62,46.08) v1(48.62,38.46) v1(48.62,30.84) v1(48.62,25.76) v1(48.62,23.22) v1(48.62,18.14) v1(48.62,15.6) v1(48.62,13.06) v1(48.62,10.52) v1(48.62,7.98) v1(48.62,5.44) v1(48.62,2.9) v1(48.92,163.02) v1(48.92,160.48) v1(48.92,157.94) v1(48.92,137.62) v1(48.92,135.08) v1(48.92,132.54) v1(48.92,130) v1(48.92,127.46) v1(48.92,124.92) v1(48.92,122.38) v1(48.92,119.84)
BAT_IN+: length 13.5
  Top Layer w0.889: CN5.2 47.16,35.49 v1(44.58,38.08) R47.2 ; v1(39.53,43.89) 41.4,42.03 v1(41.4,42.01)
  Bottom Layer w0.889: v1(44.58,38.08) 44.58,38.84 v1(42.03,41.38) v1(41.4,42.01)
  vias: v1(38.48,44.55) v1(38.73,42.9) v1(41.4,44.04)
BOOT0: length 5.1
  Top Layer w0.254: v1(23.49,98.27) 22.38,97.16 22.32,97.16
  Bottom Layer w0.254: v1(23.49,98.27) 21.11,95.88 21.11,95.76
BOOT1: length 7.8
  Top Layer w0.254: v1(26.92,106.66) 27.97,107.7 U1.28
  Bottom Layer w0.254: v1(26.92,106.66) 26.92,107.29 29.63,110 30.65,110 R72.1
BUZZER: length 38.6
  Top Layer w0.152: v1(15.37,109.83) 15.37,100.05 15.75,99.67 18.36,99.67 18.51,99.82 18.61,99.82 U1.51
  Top Layer w0.254: R85.2 7.49,125.07 6.93,124.51 6.93,111.91 v1(7.37,111.48)
  Bottom Layer w0.254: v1(15.37,109.83) 14.89,110.31 14.89,111.21 14.19,111.9 13.22,111.9 12.8,111.48 v1(7.37,111.48)
DEBUG_RX: length 50.4
  Top Layer w0.254: U1.17 33.42,103.88 37.21,107.67 37.21,109.32 34.42,112.12 v1(31.24,112.12) ; R84.1 v1(5.31,99.42)
  Bottom Layer w0.152: v1(5.31,99.42) 18.54,99.42 v1(31.24,112.12)
DEBUG_TX: length 31.4
  Top Layer w0.254: 31.86,101.05 31.04,101.88 29.17,101.88 25.86,105.18 25.79,105.18 25.45,105.52 25.45,105.6 v1(24.71,106.34) ; R83.1 v1(7.11,100.81)
  Bottom Layer w0.152: v1(7.11,100.81) 7.25,100.67 16.68,100.67 16.93,100.92 17.37,100.92 17.46,100.84 17.55,100.84 18.2,101.49 19.47,101.49 19.85,101.87 20.63,101.87 24.75,105.99 24.75,106.29 v1(24.71,106.34)
DIR1: length 83.6
  Top Layer w0.254: v1(38.61,174.6) 39.24,175.24 40.08,175.24 40.26,175.41 40.26,176.41 U15.2 ; v1(32.89,160.88) 33.53,161.52 v1(33.53,174.73) ; v1(32.77,157.58) 32.77,154.24 31.85,153.33 31.85,148.97 v1(32.26,148.56) ; U1.33 23.05,109.86 23.05,110.78 23.88,111.61 v1(23.88,132.44) ; v1(23.88,148.56) v1(23.88,135.36)
  Bottom Layer w0.254: v1(38.61,174.6) 33.65,174.6 v1(33.53,174.73) ; v1(32.77,157.58) 32.89,157.71 v1(32.89,160.88) ; v1(32.26,148.56) v1(23.88,148.56) ; v1(23.88,135.36) v1(23.88,132.44)
DIR2: length 56.5
  Top Layer w0.254: U1.34 23.18,109.03 23.18,109.13 22.69,109.61 22.69,110.93 23.18,111.41 v1(23.18,121.83) ; v1(37.59,130.51) 37.59,145.39 39.67,147.47 U19.2
  Bottom Layer w0.254: v1(37.59,130.51) 37.59,121.39 37.46,121.26 23.11,121.26 22.96,121.41 22.96,121.62 v1(23.18,121.83)
DIR3: length 50.3
  Top Layer w0.254: U1.35 21.55,109.95 v1(21.55,111.44) ; U20.2 10.8,141.32 10.8,142.01 11.43,142.64 11.43,142.72 v1(11.68,142.98) ; v1(17.91,142.72) 17.73,142.55 17.73,135.54 v1(17.91,135.36) ; v1(18.16,109.96) 17.91,110.21 v1(17.91,131.7)
  Bottom Layer w0.254: v1(18.16,109.96) 19.64,111.44 v1(21.55,111.44) ; v1(17.91,142.72) 16.64,141.45 13.21,141.45 v1(11.68,142.98) ; v1(17.91,135.36) v1(17.91,131.7)
DIR4: length 88.1
  Top Layer w0.254: v1(20.3,107.9) 20.14,108.06 20.14,108.63 19.96,108.81 19.96,112.52 20.14,112.7 v1(20.14,114.15) ; U1.36 23.14,107.65 23.14,107.55 23.35,107.34 23.35,106.99 23.14,106.78 v1(23.14,106.5) ; v1(20.32,163.04) 20.95,162.41 20.95,135.48 20.57,135.48 v1(20.45,135.36) ; v1(20.07,118.47) 20.19,118.59 v1(20.19,130.15) ; v1(22.35,174.09) 22.35,166.34 v1(22.61,166.09) ; U21.2 9.84,173.33 10.02,173.51 10.54,173.51 10.55,173.5 11.04,173.5 11.05,173.51 11.89,173.51 v1(12.06,173.33)
  Bottom Layer w0.254: v1(22.35,174.09) 21.59,173.33 v1(12.06,173.33) ; v1(23.14,106.5) 21.7,106.5 v1(20.3,107.9) ; v1(22.61,166.09) 20.32,163.81 v1(20.32,163.04) ; v1(20.19,130.15) 20.45,130.4 v1(20.45,135.36) ; v1(20.14,114.15) 20.12,114.17 20.12,117.18 20.14,117.21 20.14,118.39 v1(20.07,118.47)
ENC1_A: length 111.7
  Top Layer w0.152: U1.50 18.48,100.39 18.38,100.39 18,100.02 17.65,100.02 17.28,100.39 v1(17.15,100.39)
  Top Layer w0.254: v1(15.24,113.51) 15.24,110.53 14.78,110.07 14.78,102.44 v1(12.45,100.1) ; R40.1 47.07,169.56 45.85,169.56 45.85,163.93 45.47,163.55 45.47,159.09 45.34,158.97 45.34,130.4 46.48,129.26 v1(46.48,113.26)
  Bottom Layer w0.152: v1(12.45,100.1) 12.62,99.92 16.89,99.92 17.14,100.18
  Bottom Layer w0.254: v1(15.24,113.51) 15.49,113.26 30.54,113.26 31.01,113.73 40.51,113.73 40.98,113.26 v1(46.48,113.26)
ENC1_B: length 109.2
  Top Layer w0.152: v1(26.03,105.77) 24.89,106.91 v1(24.89,107.16)
  Top Layer w0.254: v1(44.45,153.52) 44.07,153.9 44.07,170.79 45.6,172.32 46.04,171.88 46.72,171.88 48.06,170.55 48.06,167.92 47.88,167.74 R39.1 ; v1(44.75,145.52) 44.75,131.6 v1(43.94,130.79) ; 20.55,98.93 20.59,98.93 v1(21.72,100.05) ; v1(21.79,131.35) 21.84,131.29 21.84,112.16 21.89,112.11 21.89,112 v1(22.31,111.58)
  Bottom Layer w0.152: v1(26.03,105.77) 21.72,101.45 v1(21.72,100.05) ; v1(24.89,107.16) 22.55,109.5 22.55,109.95 22.31,110.19 v1(22.31,111.58)
  Bottom Layer w0.254: v1(43.94,130.79) 43.38,131.35 v1(21.79,131.35) ; v1(44.45,153.52) 45.84,152.12 45.84,146.61 v1(44.75,145.52)
ENC2_A: length 57.1
  Top Layer w0.254: v1(22.26,132.02) 22.26,131.71 22.38,131.59 22.38,131.1 22.26,130.98 22.26,113.01 v1(22.59,112.68) ; v1(21.21,112.23) 20.83,111.85 20.83,109.16 22.22,107.77 22.32,107.77 ; v1(46.23,136.88) 46.36,137.02 R42.1
  Bottom Layer w0.254: v1(21.21,112.23) 21.74,112.23 21.8,112.17 22.59,112.17 v1(22.59,112.68) ; v1(22.26,132.02) 22.35,132.12 22.35,135.36 22.23,135.48 22.23,136.75 22.35,136.88 v1(46.23,136.88)
ENC2_B: length 62.1
  Top Layer w0.254: v1(43.43,141.33) 44.15,141.33 44.17,141.31 44.17,132.67 43.18,131.67 43.18,131.14 v1(42.67,130.63) ; v1(20.7,116.94) 21.08,116.56 21.08,113.13 20.32,112.37 20.32,108.96 21.86,107.41 21.96,107.41 ; R41.1 46.36,141.21 v1(46.6,141.45)
  Bottom Layer w0.254: v1(43.43,141.33) 43.56,141.45 v1(46.6,141.45) ; v1(42.67,130.63) 42.67,118.09 42.04,117.45 21.08,117.45 20.83,117.2
ENC3_A: length 79.6
  Top Layer w0.254: 4.33,105.4 4.34,105.39 ; 4.34,105.39 5.16,104.57 5.16,101.75 4.77,101.36 4.77,100.27 4.93,100.1 5.97,100.1 6.1,99.98 v1(6.1,94.46) ; 4.34,105.39 3.83,104.88 0.43,104.88 0.43,127.78 v1(0.76,128.12) ; R44.1 5.37,147.49 5.37,137.33 5.12,137.08 v1(5.12,134.59) ; v1(19.94,96.11) 20.83,97.01 20.83,97.19 21.51,97.87 U1.58
  Bottom Layer w0.254: v1(0.76,128.12) 1.23,128.59 1.74,128.59 5.12,131.97 v1(5.12,134.59) ; v1(19.94,96.11) 18.29,94.46 v1(6.1,94.46)
ENC3_B: length 70
  Top Layer w0.254: v1(4.44,133.2) 4.44,125.07 5.84,123.67 5.84,116.69 4.77,115.62 v1(4.77,111.73) ; v1(20.7,103.74) 23.11,101.32 23.11,98.72 22.91,98.52 22.91,98.46 21.96,97.51 ; v1(4.19,134.47) 4.19,136.43 4.29,136.53 4.29,137.62 4.19,137.73 4.19,138.74 5.01,139.56 5.01,144.66 4.48,145.19 3.06,145.19 2.72,145.53 2.72,147.94 2.6,148.07
  Bottom Layer w0.254: v1(20.7,103.74) 19.18,105.26 5.59,105.26 4.77,106.07 v1(4.77,111.73) ; v1(4.19,134.47) 4.44,134.21 v1(4.44,133.2)
ENC4_A: length 110.7
  Top Layer w0.254: U1.14 30.43,101.07 28.32,101.07 27.25,102.13 27.25,102.52 26.91,102.86 26.53,102.86 v1(25.65,103.73) ; v1(12.57,127.1) 13.16,127.69 13.16,140.81 12.7,141.26 v1(12.7,149.33) ; R46.1 3.88,156.83 3.94,156.77 v1(3.94,149.58) ; v1(8,110.72) 8,116.77 7.8,116.97 7.8,117.46 8,117.66 8,117.7 7.37,118.34 7.37,123.93 ; 6.76,100.34 6.6,100.18 6.6,99.92 6.68,99.85 v1(6.68,95.35) ; v1(6.76,103.1) v1(6.76,105.84)
  Bottom Layer w0.254: v1(6.76,105.84) 8,107.08 v1(8,110.72) ; v1(6.76,100.09) 6.76,100.34 6.53,100.57 6.53,101.06 6.76,101.29 v1(6.76,103.1) ; v1(3.94,149.58) 4.19,149.33 v1(12.7,149.33) ; v1(6.68,95.35) 7.19,94.84 18.03,94.84 18.54,95.35 18.54,96.37 21.64,99.47 21.96,99.47 22.3,99.81 22.3,100.38 v1(25.65,103.73) ; v1(7.52,123.93) 7.52,126.19 7.37,126.34 7.37,126.59 7.55,126.77 12.24,126.77 v1(12.57,127.1)
ENC4_B: length 107.7
  Top Layer w0.254: v1(9.02,108.94) 9.02,115.04 v1(8.89,115.16) ; v1(1.02,115.42) 1.02,116.24 0.91,116.35 0.91,127.44 1.35,127.88 1.35,127.94 1.52,128.12 1.52,130.79 1.81,131.08 1.84,131.08 2.48,131.71 2.48,131.74 v1(2.67,131.93) ; v1(3.43,170.16) 3.5,170.23 4.52,170.23 4.7,170.41 4.7,178.27 R45.1 ; 31.51,100.7 30.68,101.52 28.75,101.52 24.52,105.75 v1(23.76,105.75)
  Bottom Layer w0.254: v1(8.89,115.16) 8.64,115.42 v1(1.02,115.42) ; v1(2.67,131.93) 2.72,131.98 2.72,165.27 3.06,165.61 3.2,165.61 3.43,165.83 v1(3.43,170.16) ; v1(9.02,108.94) 18.16,108.94 19.3,110.08 21.46,110.08 23.76,107.78 v1(23.76,105.75)
ESTOP_ACTIVE: length 11.1
  Top Layer w0.254: CN7.2 v1(5.21,117.22) ; C90.1 8.44,120.81 R80.2 8.44,120.71 R79.2 8.44,118.65 8.38,118.59 v1(8.38,117.22)
  Bottom Layer w0.254: v1(5.21,117.22) v1(8.38,117.22)
I2C1_SCL: length 124.9
  Top Layer w0.254: v1(18.67,91.92) 18.8,91.8 v1(18.8,81.89) ; v1(20.65,92.05) 20.65,92.89 20.75,92.99 21.07,92.99 21.41,93.33 21.41,93.97 21.54,94.09 21.54,94.58 21.41,94.7 21.41,95.55 U1.61 ; v1(39.88,31.72) 39.88,31.28 39.95,31.21 39.95,29.45 U22.5 39.95,29.27 v1(39.95,27.91) ; v1(42.85,27.91) 42.85,30.17 R50.2 ; v1(28.21,90.4) 27.98,90.17 27.98,32.19 v1(28.45,31.72) ; CN6.3 1.54,83.41 v1(3.43,83.41)
  Bottom Layer w0.254: v1(42.85,27.91) 42.44,27.51 40.36,27.51 v1(39.95,27.91) ; v1(18.67,91.92) 20.52,91.92 v1(20.65,92.05) 20.65,91.03 27.58,91.03 v1(28.21,90.4) ; v1(18.8,81.89) 18.67,81.76 5.08,81.76 v1(3.43,83.41) ; v1(39.88,31.72) v1(28.45,31.72)
I2C1_SDA: length 128
  Top Layer w0.254: v1(39.37,30.96) 39.36,30.96 U22.4 39.37,29.35 v1(39.37,27.41) ; v1(28.07,91.54) 27.63,91.1 27.63,31.02 v1(27.69,30.96) ; v1(43.49,27.48) 43.49,29.58 43.69,29.78 43.69,31.46 R49.1 ; U1.62 22,95.43 22,93.89 21.99,93.89 21.99,93.41 21.29,92.71 v1(21.29,91.62) 20.7,91.03 20.7,88.91 20.76,88.85 20.76,87.37 20.7,87.31 v1(20.7,81)
  Bottom Layer w0.254: v1(39.37,27.41) 39.62,27.15 43.17,27.15 v1(43.49,27.48) ; v1(21.29,91.62) 21.52,91.39 27.92,91.39 v1(28.07,91.54) ; v1(20.7,81) 20.63,80.93 CN6.4 ; v1(39.37,30.96) v1(27.69,30.96)
I2C2_SCL: length 77.3
  Top Layer w0.254: U1.29 28.19,108.69 28.29,108.69 28.4,108.8 28.75,108.8 28.86,108.69 v1(29.21,108.69) ; 31.36,60.45 31.5,60.32 v1(31.5,58.9) ; v1(39.75,58.78) 39.75,108.31 39.5,108.56 39.24,108.56 39.13,108.67 v1(39.13,108.94)
  Bottom Layer w0.254: v1(29.21,108.69) 29.27,108.62 29.53,108.62 29.84,108.94 v1(39.13,108.94) ; v1(39.75,58.78) 39.93,58.6 39.93,58.51 39.56,58.14 32.26,58.14 v1(31.5,58.9) 32.72,60.13 R69.2
I2C2_SDA: length 86.9
  Top Layer w0.254: v1(40.51,94.08) 40.51,112.9 v1(40.27,113.14) ; v1(40.51,91.29) 40.33,91.11 40.33,58.45 v1(40.51,58.27) ; U1.30 28.26,109.47 v1(28.26,109.89) ; 30.71,60.45 v1(30.71,58.65)
  Bottom Layer w0.254: v1(40.27,113.14) 40.13,113.01 31.37,113.01 31.06,112.7 31,112.7 30.66,112.36 30.66,112.29 v1(28.26,109.89) ; R68.1 30.71,61.69 v1(30.71,58.65) 30.71,57.97 31.13,57.56 35.55,57.56 35.57,57.58 36.06,57.58 36.08,57.56 39.8,57.56 v1(40.51,58.27) ; v1(40.51,91.29) v1(40.51,94.08)
M1_MOTOR1: length 7.7
  Top Layer w0.254: U15.8 44.08,173.47 v1(44.07,173.46)
  Bottom Layer w0.254: CN10.1 48.54,173.46 v1(44.07,173.46)
M1_MOTOR2: length 8.4
  Top Layer w0.254: v1(47.24,185.9) 47.37,185.78 v1(47.37,184.51) ; U15.10 43.63,182.44 43.63,183.12 43.9,183.39 44.27,183.39 44.2,183.46 v1(44.2,183.62)
  Bottom Layer w0.254: v1(44.2,183.62) 45.08,184.51 v1(47.37,184.51) ; v1(47.24,185.9) 48.49,185.9 CN10.6
M2_MOTOR1: length 8.4
  Top Layer w0.254: U19.8 v1(43.57,144.25) ; v1(46.74,144.37) 47.78,144.37 CN11.1
  Bottom Layer w0.254: v1(43.57,144.25) 46.61,144.25 v1(46.74,144.37)
M2_MOTOR2: length 7.7
  Top Layer w0.254: CN11.6 46.76,156.97 v1(46.74,156.95) ; U19.10 43.12,154.24 43.12,154.93 43.18,154.99 v1(43.18,156.95)
  Bottom Layer w0.254: v1(46.74,156.95) v1(43.18,156.95)
M3_MOTOR1: length 8.7
  Top Layer w0.254: v1(6.6,144.5) 6.6,141.22 U20.8 ; 1.4,144.66 1.55,144.5 v1(4.06,144.5)
  Bottom Layer w0.254: v1(4.06,144.5) v1(6.6,144.5)
M3_MOTOR2: length 8.1
  Top Layer w0.254: 1.4,132.16 3.02,133.78 7.06,133.78 7.35,134.07 7.35,135.38
M4_MOTOR1: length 7.5
  Top Layer w0.254: 1.27,174.75 v1(2.54,174.75) ; U21.8 5.97,171.97 v1(5.97,174.75)
  Bottom Layer w0.254: v1(2.54,174.75) v1(5.97,174.75)
M4_MOTOR2: length 7.4
  Top Layer w0.254: v1(3.35,163.99) 1.61,162.25 1.27,162.25 ; U21.10 6.39,166 6.39,165.31 5.52,164.44 v1(4.83,164.44)
  Bottom Layer w0.254: v1(3.35,163.99) 3.49,164.13 4.52,164.13 v1(4.83,164.44)
MOTOR_EN: length 172.5
  Top Layer w0.254: v1(16.26,95.99) 16.51,95.73 17.65,95.73 17.93,96.01 R37.1 18.81,99.18 18.81,99.21 19.49,99.89 U1.52 ; U28.1 11.31,171.43 10.68,170.79 9.65,170.79 9.39,171.06 9.39,171.41 9.19,171.6 U21.3 ; U28.1 v1(16.51,171.43) ; U28.1 v1(14.86,166.17) ; v1(16.13,163.04) v1(16.13,152.88) ; v1(34.67,157.58) 36.38,155.87 36.38,153.68 36.96,153.1 v1(36.96,148.95) ; v1(39.75,174.47) 39.67,174.4 39.67,170.21 v1(39.37,169.9) ; v1(11.18,95.73) 11.18,115.67 9.27,117.58 9.27,118.28 9.17,118.38 9.17,124.4 9.28,124.52 9.28,125.61 9.27,125.62 9.27,126.98 12.57,130.28 12.57,139.17 11.77,139.97 10.42,139.97 9.95,140.44 U20.3 9.95,142.61 v1(10.4,143.05) ; U19.3 v1(40.32,146.91) ; U15.3 41.02,176.3 v1(41.02,174.73) ; v1(16.13,149.96) v1(16.13,144.63)
  Bottom Layer w0.254: v1(34.67,157.58) 34.67,160 39.37,164.69 v1(39.37,169.9) 18.03,169.9 v1(16.51,171.43) ; v1(16.13,152.88) v1(16.13,149.96) ; v1(16.13,144.63) 15.75,144.25 10.85,144.25 10.67,144.07 9.96,144.07 9.77,144.26 9.28,144.26 8.94,143.92 8.94,143.43 9.32,143.05 v1(10.4,143.05) ; v1(40.32,146.91) 40.32,149.13 40.13,149.33 37.34,149.33 v1(36.96,148.95) ; v1(39.75,174.47) 40.77,174.47 v1(41.02,174.73) ; v1(14.86,166.17) 16.05,166.17 16.13,166.09 v1(16.13,163.04) ; v1(16.26,95.99) 15.45,95.99 14.86,95.39 13.84,95.39 13.25,95.99 11.43,95.99 v1(11.18,95.73)
NRF_CE: length 61
  Top Layer w0.254: 28.68,107.06 28.6,107.06 v1(27.18,105.64) ; H19.3 47.11,78.72 46.93,78.89 46.93,81.51 46.15,82.28 46.15,82.77 46.61,83.22 46.61,83.8 46.93,84.11 46.93,91.77 46.2,92.5 46.2,105.8 46.68,106.29 46.68,107.34 v1(46.61,107.42)
  Bottom Layer w0.254: v1(27.18,105.64) 28.96,107.42 v1(46.61,107.42) ; H19.3 48.21,78.51 49.39,78.51 49.57,78.33 49.57,74.43 R76.1
NRF_CSN: length 44.4
  Top Layer w0.254: v1(29.46,103.86) 29.73,103.86 U1.20 ; v1(41.16,103.73) 41.16,94.14 41.94,93.35 41.94,91.76 41.61,91.43 41.61,80.69 v1(41.54,80.62)
  Bottom Layer w0.254: R77.1 41.54,79.61 ; 41.54,79.61 41.91,79.98 45.47,79.98 H19.4 ; 41.54,79.61 v1(41.54,80.62) ; v1(29.46,103.86) 29.59,103.73 v1(41.16,103.73)
NRF_IRQ: length 42.3
  Top Layer w0.254: v1(29.84,108.05) 29.5,108.05 29.46,108.09 29.1,108.09 29.07,108.05 28.97,108.05 U1.27 ; H19.8 45.76,84.09 45.76,91.61 45.49,91.88 45.49,106.74 45.59,106.85 v1(45.59,108.18)
  Bottom Layer w0.254: v1(45.59,108.18) 45.47,108.05 v1(29.84,108.05)
NRF_MISO: length 41.4
  Top Layer w0.254: v1(46.1,106.53) 45.85,106.27 45.85,92.03 v1(46.34,91.53) ; v1(48.13,91.29) 48.01,91.16 H19.7 ; v1(31.11,106.78) 30.77,106.44 30.77,106.42 30.1,105.75 30.1,105.65
  Bottom Layer w0.254: v1(46.1,106.53) 31.37,106.53 v1(31.11,106.78) ; v1(48.13,91.29) 46.59,91.29 v1(46.34,91.53)
NRF_MOSI: length 46.9
  Top Layer w0.254: v1(41.26,105.26) 41.26,104.71 41.74,104.23 41.74,94.07 42.3,93.52 42.3,80.94 v1(42.3,80.94) ; H19.6 46.34,80.38 v1(46.34,79.8) ; v1(28.07,104.5) 28.89,105.32 28.96,105.32 29.64,106 U1.23
  Bottom Layer w0.254: v1(28.07,104.5) 28.83,105.26 v1(41.26,105.26) ; v1(46.34,79.8) 46.34,79.81 45.22,80.94 v1(42.3,80.94)
NRF_SCK: length 45.7
  Top Layer w0.254: H19.5 v1(46.74,82.53) ; v1(28.32,103.73) 29.2,104.62 29.67,104.62 30.35,105.29 30.45,105.29 ; v1(42.88,82.47) 42.65,82.7 42.65,93.67 42.19,94.13 42.19,104.61 v1(41.94,104.86)
  Bottom Layer w0.254: v1(46.74,82.53) 46.55,82.72 43.12,82.72 v1(42.88,82.47) ; v1(41.94,104.86) 41.69,104.86 41.5,104.67 41.02,104.67 40.83,104.86 37.45,104.86 36.96,104.37 29.78,104.37 29.71,104.45 29.22,104.45 29.15,104.37 28.96,104.37 v1(28.32,103.73)
NRST: length 27.5
  Top Layer w0.254: H17.5 47.12,95.23 v1(46.99,95.1) ; v1(38.35,92.81) 37.08,92.81 KEY1.1 34.99,92.56 C97.1 ; 34.42,92.43 34.12,92.43 U1.7 28.68,97.91 v1(27.69,98.91)
  Bottom Layer w0.254: v1(27.69,98.91) R14.1 ; v1(46.99,95.1) 40.64,95.1 v1(38.35,92.81)
OSC_IN: length 17.9
  Top Layer w0.254: R13.2 C24.2 ; C24.2 30.8,90.97 29.46,92.3 29.46,95.67 U1.5 ; C24.2 30.8,88.17 30.62,87.99 29.72,87.99 29.46,87.73 29.46,85.19 29.58,85.08 X5.1
OSC_OUT: length 14.3
  Top Layer w0.254: U1.6 28.43,97.51 33.1,92.84 ; X5.3 34.02,86.83 34.41,87.22 R13.1 34.29,89 33.09,90.2 C10.2 33.09,92.84
PC0: length 63.8
  Top Layer w0.254: v1(32.71,94.66) 29.83,97.55 29.81,97.55 29.14,98.22 U1.8 ; R80.1 10.02,120.88 v1(15.87,120.88) ; v1(37.72,94.84) 37.72,120.24 v1(37.46,120.5)
  Bottom Layer w0.254: v1(32.71,94.66) 37.54,94.66 v1(37.72,94.84) ; v1(15.87,120.88) 37.08,120.88 v1(37.46,120.5)
PWM1: length 88.8
  Top Layer w0.254: v1(21.59,132.44) 21.59,132.18 20.9,131.5 20.9,118.16 19.56,116.81 19.56,107.7 U1.41 ; v1(21.59,163.04) 21.64,162.99 v1(21.64,144.63) ; U15.1 38.66,175.62 36.7,175.62 36.52,175.44 v1(36.52,163.3)
  Bottom Layer w0.254: v1(21.59,163.04) 21.84,163.3 v1(36.52,163.3) ; v1(21.64,144.63) 21.55,144.53 21.55,132.48 v1(21.59,132.44)
PWM2: length 61.7
  Top Layer w0.254: 20.55,106 18.92,107.63 18.92,130.15 v1(18.8,130.28) ; U19.1 39.02,147.97 v1(37.97,146.91) ; v1(18.8,135.61) 18.8,145.39 v1(20.32,146.91)
  Bottom Layer w0.254: v1(18.8,135.61) v1(18.8,130.28) ; v1(37.97,146.91) v1(20.32,146.91)
PWM3: length 42.5
  Top Layer w0.254: U20.1 11.81,140.56 v1(12.57,140.56) ; v1(17.14,140.44) v1(17.14,135.36) ; v1(17.27,132.44) 17.27,108.47 20.1,105.65 20.2,105.65
  Bottom Layer w0.254: v1(17.14,135.36) 17.14,134.53 17.35,134.33 17.35,133.84 17.14,133.64 17.14,132.56 v1(17.27,132.44) ; v1(17.14,140.44) 17.02,140.56 v1(12.57,140.56)
PWM4: length 80.9
  Top Layer w0.254: U21.1 10.49,172.06 v1(11.18,172.75) ; 13.54,142.54 13.54,133.25 13.72,133.07 16.26,133.07 16.69,132.64 16.69,132.19 16.76,132.12 16.76,108.37 19.84,105.29 ; v1(17.27,157.58) v1(17.27,163.04)
  Bottom Layer w0.254: v1(17.27,163.04) 17.27,165.96 16.38,166.85 12.83,166.85 12.65,167.03 12.65,167.12 12.78,167.25 12.78,167.73 12.65,167.86 12.65,172.01 12.47,172.19 11.74,172.19 v1(11.18,172.75) ; v1(13.59,142.47) 13.97,142.85 16.38,142.85 16.56,143.03 16.56,144.23 16.71,144.39 16.71,153.12 16.56,153.28 16.56,156.87 v1(17.27,157.58)
SERVO1_PWM: length 65.9
  Top Layer w0.254: v1(28.63,38.52) 29.28,38.52 29.28,55.04 29.46,55.22 29.85,55.22 29.86,55.23 32.86,55.23 33.4,54.7 33.4,54.14 33.31,54.05 ; v1(32.26,38.58) 32.26,16.49 v1(32.89,15.85) ; v1(26.83,15.6) 26.81,15.57 R56.1
  Bottom Layer w0.254: v1(32.26,38.58) 31.98,38.58 31.64,38.92 29.04,38.92 28.81,38.7 28.81,38.7 v1(28.63,38.52) ; v1(26.83,15.6) 27.09,15.85 v1(32.89,15.85)
SERVO2_PWM: length 67.7
  Top Layer w0.254: v1(39.37,5.31) 39.03,5.65 39.03,7.32 38.35,8 v1(38.35,10.52) ; v1(28.57,39.28) 28.57,41.03 28.93,41.39 28.93,55.19 29.33,55.59 33.01,55.59 33.37,55.23 33.52,55.23 33.96,54.78 33.96,54.05 ; v1(32.67,39.25) 32.67,39.03 32.93,38.78 32.93,16.64 33.77,15.8 33.77,13.38 33.25,12.86 v1(33.25,10.52)
  Bottom Layer w0.254: R58.1 38.47,5.31 v1(39.37,5.31) ; v1(33.25,10.52) v1(38.35,10.52) ; v1(32.67,39.25) 32.64,39.28 v1(28.57,39.28)
SERVO3_PWM: length 93.5
  Top Layer w0.254: v1(2.03,7.98) 1.4,8.61 1.4,16.63 2.63,17.86 2.63,29.35 2.16,29.82 2.16,30.46 1.4,31.22 v1(1.4,34.65) ; v1(11.18,56.49) 11.18,50.01 v1(9.78,48.62) ; v1(34.54,56.49) 34.61,56.42 34.61,54.05 ; v1(6.35,7.98) 6.35,4.47 6.17,4.29 R60.1
  Bottom Layer w0.254: v1(2.03,7.98) v1(6.35,7.98) ; v1(34.54,56.49) v1(11.18,56.49) ; v1(1.4,34.65) 2.03,35.28 2.03,48.36 2.29,48.62 v1(9.78,48.62)
SERVO4_PWM: length 80.2
  Top Layer w0.254: 35.27,54.05 35.27,55.56 v1(35.43,55.73) ; v1(9.78,35.79) 10.93,36.94 10.93,44.48 11.1,44.64 12.06,44.64 v1(12.06,55.86) ; v1(8.76,30.07) 8.76,3.86 8.94,3.68 R64.1
  Bottom Layer w0.254: v1(9.78,35.79) 9.78,31.09 v1(8.76,30.07) ; v1(12.06,55.86) 12.19,55.73 v1(35.43,55.73)
SERVO5_PWM: length 73.5
  Top Layer w0.254: v1(19.68,41.25) 20.12,40.82 20.12,14.76 v1(18.03,12.68) ; R66.1 18.17,6.82 v1(18.16,6.83) ; v1(35.81,57) 35.92,56.9 35.92,56.07 36.02,55.97 36.02,55.49 35.92,55.38 35.92,54.05 ; v1(19.43,45.95) 19.43,56.87 v1(18.8,57.51)
  Bottom Layer w0.254: v1(19.68,41.25) 19.43,41.5 v1(19.43,45.95) ; v1(18.03,12.68) 18.03,6.96 v1(18.16,6.83) ; v1(18.8,57.51) 19.3,57 34.23,57 34.3,57.07 34.79,57.07 34.86,57 v1(35.81,57)
SERVO6V_A: length 48.1
  Top Layer w0.254: C70.1 37.07,6.58 v1(34.8,6.58)
  Top Layer w0.381: U31.1 26.26,16.41
  Top Layer w0.508: C80.1 47.12,21.93 v1(47.12,18.72) ; L4.1 26,16.15 26,4.29 v1(25.49,3.78)
  Bottom Layer w0.254: v1(34.8,6.58) 34.8,2.39 KG30.2
  Bottom Layer w0.508: v1(47.12,18.72) L4.1
SERVO6V_B: length 79
  Top Layer w0.508: C81.1 14.88,48.87 14.88,43.05 13.21,41.38 v1(12.57,41.38) ; v1(6.22,24.49) v1(6.22,18.14) ; v1(12.46,36.3) 12.79,36.3 C77.1 19.13,33.43 19.63,32.92 19.63,26.26 13.33,26.26 12.95,26.65 ; 12.95,26.65 v1(12.19,27.41) ; 12.95,26.65 U29.1 ; v1(12.7,16.87) v1(12.7,3.91)
  Bottom Layer w0.508: v1(6.22,18.14) 11.1,18.14 11.35,18.39 12.7,17.04 v1(12.7,16.87) ; v1(12.46,36.3) 12.46,41.26 v1(12.57,41.38) ; v1(12.19,27.41) 4.31,27.41 R54.1 4.13,27.48 C79.2 C76.1 6.22,25.56 v1(6.22,24.49)
SERVO_OE_N: length 73.2
  Top Layer w0.254: v1(28.58,79.1) 28.58,72.74 28.57,72.74 v1(28.57,65.38) ; v1(33.27,58.9) 33.27,60.41 33.31,60.45 ; U32.1 14.35,79.86 v1(15.11,79.1) ; v1(36.58,61.95) v1(36.58,65.38) ; v1(21.08,100.94) 21.08,100.88 U1.53
  Bottom Layer w0.254: 14.61,97.64 14.73,97.77 16.77,97.77 17.24,98.23 18.24,98.23 R86.1 ; v1(15.11,79.1) v1(28.58,79.1) ; v1(33.27,58.9) 33.27,60.05 R70.1 36.44,62.09 v1(36.58,61.95) ; v1(21.08,100.94) 18.57,98.42 18.57,98.3 ; v1(36.58,65.38) 28.45,65.38
